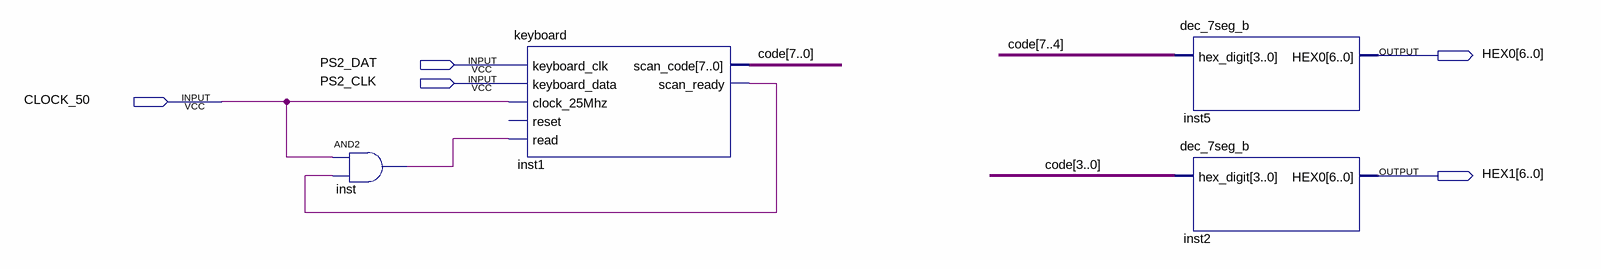
[diagram p0: schematic sheet]
// Quartus schematic KEYBOARD_keycode.bdf as structural Verilog: 4 symbols, 5 pins
module KEYBOARD_keycode (
  input  PS2_DAT,
  input  PS2_CLK,
  input  CLOCK_50,
  output [6:0] HEX0,
  output [6:0] HEX1
);

  wire inst1_scan_ready, inst_out;
  wire [7:0] code;

  and inst (inst_out, CLOCK_50, inst1_scan_ready);
  keyboard inst1 (
    .keyboard_clk(PS2_DAT), .keyboard_data(PS2_CLK), .clock_25Mhz(CLOCK_50), .read(inst_out),
    .scan_code(code), .scan_ready(inst1_scan_ready));  // open: reset
  dec_7seg_b inst5 (.hex_digit(code[7:4]), .HEX0(HEX0));
  dec_7seg_b inst2 (.hex_digit(code[3:0]), .HEX0(HEX1));
endmodule
